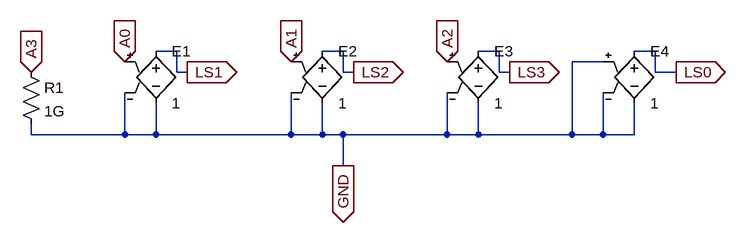
[diagram p0: schematic 4bit_LeftShift.asc]
4bit_LeftShift.asc, the LTspice schematic file:
Version 4.1
SHEET 1 1944 680
WIRE 1056 -176 1024 -176
WIRE 1312 -176 1280 -176
WIRE 1552 -176 1520 -176
WIRE 1792 -176 1760 -176
WIRE 1712 -160 1664 -160
WIRE 1056 -144 1056 -176
WIRE 1072 -144 1056 -144
WIRE 1312 -144 1312 -176
WIRE 1328 -144 1312 -144
WIRE 1552 -144 1552 -176
WIRE 1568 -144 1552 -144
WIRE 1792 -144 1792 -176
WIRE 1824 -144 1792 -144
WIRE 832 -48 832 -64
WIRE 976 -48 976 -112
WIRE 976 -48 832 -48
WIRE 1024 -48 1024 -96
WIRE 1024 -48 976 -48
WIRE 1232 -48 1232 -112
WIRE 1232 -48 1024 -48
WIRE 1280 -48 1280 -96
WIRE 1280 -48 1232 -48
WIRE 1312 -48 1280 -48
WIRE 1472 -48 1472 -112
WIRE 1472 -48 1312 -48
WIRE 1520 -48 1520 -96
WIRE 1520 -48 1472 -48
WIRE 1664 -48 1664 -160
WIRE 1664 -48 1520 -48
WIRE 1712 -48 1712 -112
WIRE 1712 -48 1664 -48
WIRE 1760 -48 1760 -96
WIRE 1760 -48 1712 -48
WIRE 1312 0 1312 -48
FLAG 976 -160 A0
IOPIN 976 -160 In
FLAG 1232 -160 A1
IOPIN 1232 -160 In
FLAG 1472 -160 A2
IOPIN 1472 -160 In
FLAG 1824 -144 LS0
IOPIN 1824 -144 Out
FLAG 1072 -144 LS1
IOPIN 1072 -144 Out
FLAG 1328 -144 LS2
IOPIN 1328 -144 Out
FLAG 1568 -144 LS3
IOPIN 1568 -144 Out
FLAG 832 -144 A3
IOPIN 832 -144 In
FLAG 1312 0 GND
IOPIN 1312 0 Out
SYMBOL e 1024 -192 R0
SYMATTR InstName E1
SYMATTR Value 1
SYMBOL e 1280 -192 R0
SYMATTR InstName E2
SYMATTR Value 1
SYMBOL e 1520 -192 R0
SYMATTR InstName E3
SYMATTR Value 1
SYMBOL e 1760 -192 R0
SYMATTR InstName E4
SYMATTR Value 1
SYMBOL res 816 -160 R0
SYMATTR InstName R1
SYMATTR Value 1G

The netlist it stands for:
* 4bit_LeftShift.asc
E1 LS1 GND A0 GND 1
E2 LS2 GND A1 GND 1
E3 LS3 GND A2 GND 1
E4 LS0 GND GND GND 1
R1 A3 GND 1G
.backanno
.end